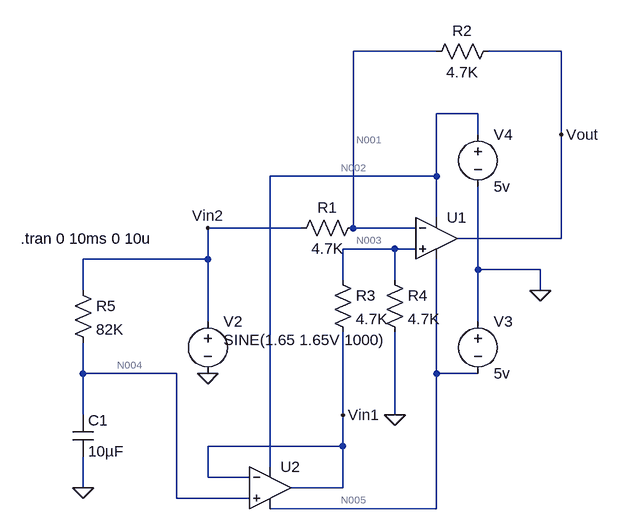
[diagram p0: schematic offset_regelaar.asc]
offset_regelaar.asc, the LTspice schematic file:
Version 4.1
SHEET 1 880 680
WIRE 176 -160 48 -160
WIRE 368 -160 256 -160
WIRE 240 -64 176 -64
WIRE 240 -32 240 -64
WIRE 368 -32 368 -160
WIRE 176 32 176 -64
WIRE 176 32 -80 32
WIRE 176 96 176 32
WIRE -32 112 -176 112
WIRE 48 112 48 -160
WIRE 144 112 48 112
WIRE 368 128 368 -32
WIRE 368 128 208 128
WIRE 112 144 32 144
WIRE 144 144 112 144
WIRE -176 160 -176 112
WIRE -176 160 -368 160
WIRE 240 176 240 48
WIRE 336 176 240 176
WIRE 32 192 32 144
WIRE 112 192 112 144
WIRE -368 208 -368 160
WIRE 336 208 336 176
WIRE -176 256 -176 160
WIRE 240 256 240 176
WIRE -368 336 -368 288
WIRE -224 336 -368 336
WIRE 176 336 176 160
WIRE 240 336 176 336
WIRE -368 400 -368 336
WIRE 32 400 32 272
WIRE 112 400 112 272
WIRE 32 448 32 400
WIRE 32 448 -176 448
WIRE -80 480 -80 32
WIRE -176 496 -176 448
WIRE -112 496 -176 496
WIRE -368 512 -368 464
WIRE 32 512 32 448
WIRE 32 512 -48 512
WIRE -224 528 -224 336
WIRE -112 528 -224 528
WIRE 176 544 176 336
WIRE 176 544 -80 544
FLAG -176 336 0
FLAG 336 208 0
FLAG 32 400 Vin1
FLAG -176 112 Vin2
FLAG 368 -32 Vout
FLAG -368 512 0
FLAG 112 400 0
SYMBOL OpAmps\\UniversalOpAmp 176 128 R0
SYMATTR InstName U1
SYMBOL voltage -176 240 R0
WINDOW 3 24 44 Left 2
WINDOW 123 0 0 Left 0
WINDOW 39 0 0 Left 0
SYMATTR Value SINE(1.65 1.65V 1000)
SYMATTR InstName V2
SYMBOL voltage 240 240 R0
WINDOW 123 0 0 Left 0
WINDOW 39 0 0 Left 0
SYMATTR InstName V3
SYMATTR Value 5v
SYMBOL voltage 240 -48 R0
WINDOW 123 0 0 Left 0
WINDOW 39 0 0 Left 0
SYMATTR InstName V4
SYMATTR Value 5v
SYMBOL res 64 96 R90
WINDOW 0 0 56 VBottom 2
WINDOW 3 32 56 VTop 2
SYMATTR InstName R1
SYMATTR Value 4.7K
SYMBOL res 272 -176 R90
WINDOW 0 0 56 VBottom 2
WINDOW 3 32 56 VTop 2
SYMATTR InstName R2
SYMATTR Value 4.7K
SYMBOL res -384 192 R0
SYMATTR InstName R5
SYMATTR Value 82K
SYMBOL cap -384 400 R0
SYMATTR InstName C1
SYMATTR Value 10µF
SYMBOL res 16 176 R0
SYMATTR InstName R3
SYMATTR Value 4.7K
SYMBOL res 96 176 R0
SYMATTR InstName R4
SYMATTR Value 4.7K
SYMBOL OpAmps\\UniversalOpAmp -80 512 R0
SYMATTR InstName U2
TEXT -464 128 Left 2 !.tran 0 10ms 0 10u

The netlist it stands for:
* offset_regelaar.asc
X§U1 N003 N001 N002 N005 Vout level1 Avol=1Meg GBW=10Meg Vos=0 En=0 Enk=0 In=0 Ink=0 Rin=500Meg  ; pins In+ In- V+ V- OUT
V2 Vin2 0 SINE(1.65 1.65V 1000)
V3 0 N005 5v
V4 N002 0 5v
R1 N001 Vin2 4.7K
R2 Vout N001 4.7K
R5 Vin2 N004 82K
C1 N004 0 10µF
R3 N003 Vin1 4.7K
R4 N003 0 4.7K
X§U2 N004 Vin1 N002 N005 Vin1 level1 Avol=1Meg GBW=10Meg Vos=0 En=0 Enk=0 In=0 Ink=0 Rin=500Meg  ; pins In+ In- V+ V- OUT
.tran 0 10ms 0 10u
.lib UniversalOpAmp1.lib
.backanno
.end

* Results of the author's LTspice run, read from the files saved beside the schematic
* Operating Point, zero values left out:
*   V(n001) = 824.9 mV
*   V(n005) = -5 V
*   V(vout) = -272.2 µV
*   V(n004) = 1.65 V
*   V(n003) = 824.9 mV
*   V(n002) = 5 V
*   V(vin2) = 1.65 V
*   V(vin1) = 1.65 V
*   I(R5) = 3.299 nA
*   I(R3) = -175.5 µA
*   I(R4) = 175.5 µA
*   I(V2) = -175.6 µA
*   I(V4) = -15.05 nA
*   I(R2) = -175.6 µA
*   I(V3) = -24.95 nA
*   I(R1) = -175.6 µA
*   Ix(u2:1) = 3.299 nA
*   Ix(u2:2) = 3.299 nA
*   Ix(u2:3) = 6.701 nA
*   Ix(u2:4) = -13.3 nA
*   Ix(u2:5) = -175.5 µA
*   Ix(u1:1) = 1.65 nA
*   Ix(u1:2) = 1.65 nA
*   Ix(u1:3) = 8.35 nA
*   Ix(u1:4) = -11.65 nA
*   Ix(u1:5) = 175.6 µA
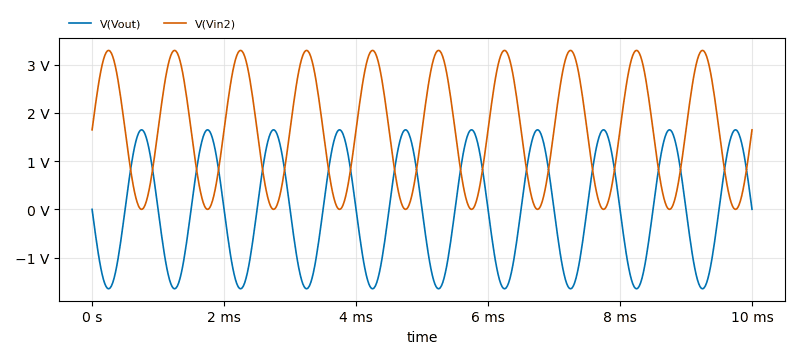
[diagram p1: Transient Analysis of offset_regelaar.asc, plotted from the saved traces]
* Transient Analysis, 1 run:
*   V(Vout): min -1.65 V, max 1.65 V, average 547.6 µV, rms 1.167 V, last 53.91 µV
*   V(Vin2): min 314.4 µV, max 3.3 V, average 1.649 V, rms 2.021 V, last 1.65 V